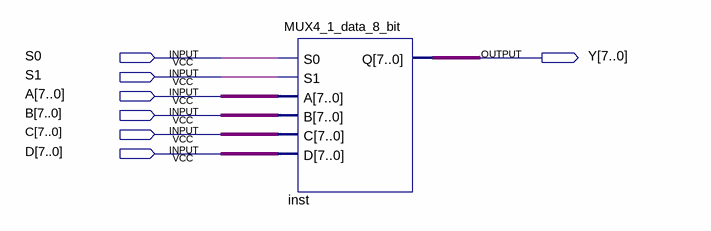
[diagram p0: schematic sheet]
// Quartus schematic test_mux_4.bdf as structural Verilog: 1 symbols, 7 pins
module test_mux_4 (
  input  S0,
  input  S1,
  input  [7:0] A,
  input  [7:0] B,
  input  [7:0] C,
  input  [7:0] D,
  output [7:0] Y
);

  MUX4_1_data_8_bit inst (.S0(S0), .S1(S1), .A(A), .B(B), .C(C), .D(D), .Q(Y));
endmodule
